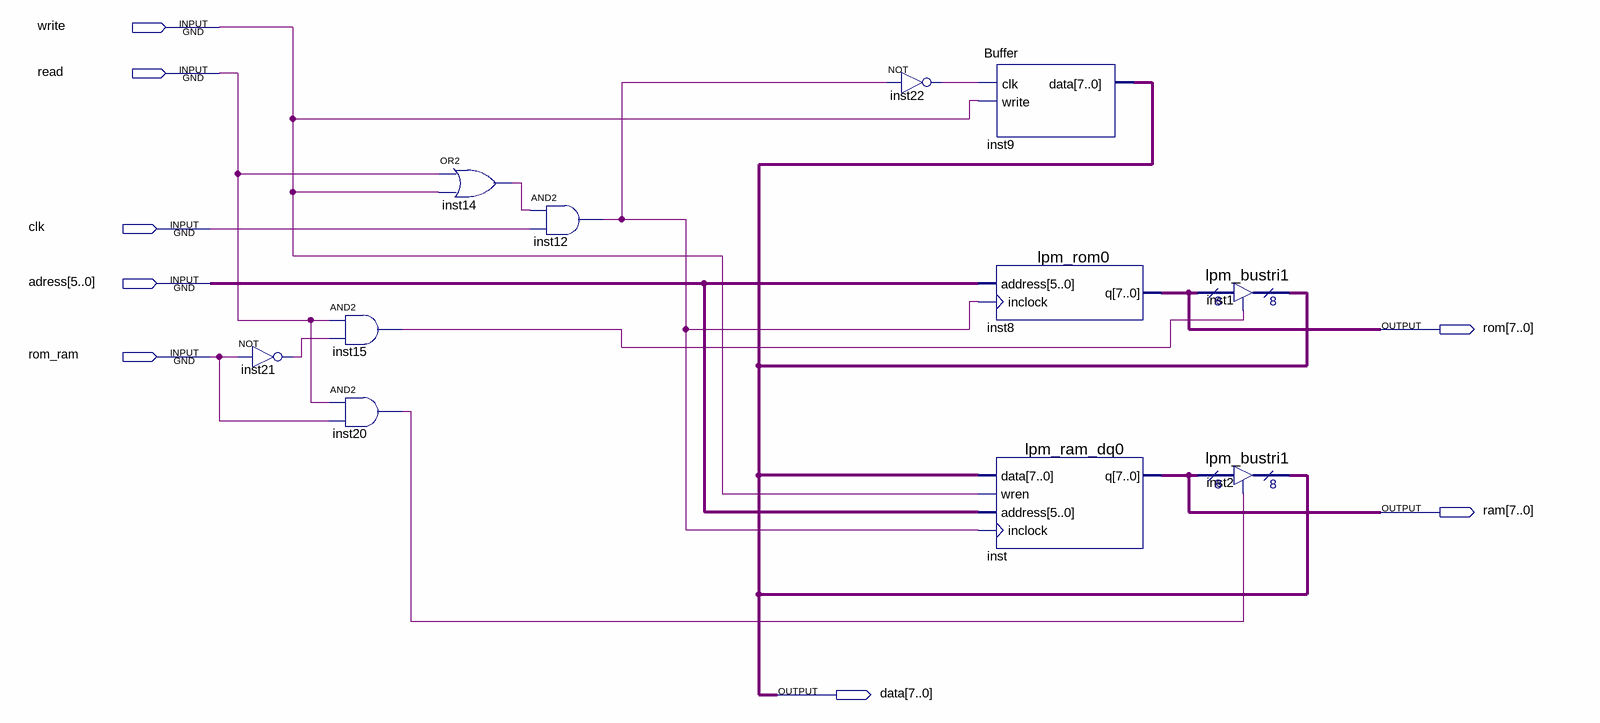
[diagram p0: schematic sheet]
// Quartus schematic lab3.bdf as structural Verilog: 11 symbols, 8 pins
module lab3 (
  input  write,
  input  read,
  input  clk,
  input  [5:0] adress,
  input  rom_ram,
  output [7:0] rom,
  output [7:0] ram,
  output [7:0] data
);

  wire inst12_out, inst14_out, inst15_out, inst20_out, inst21_out, inst22_out;

  not inst21 (inst21_out, rom_ram);
  and inst15 (inst15_out, read, inst21_out);
  and inst20 (inst20_out, read, rom_ram);
  or inst14 (inst14_out, read, write);
  and inst12 (inst12_out, inst14_out, clk);
  not inst22 (inst22_out, inst12_out);
  Buffer inst9 (.clk(inst22_out), .write(write), .data(data));
  lpm_rom0 inst8 (.address(adress), .inclock(inst12_out), .q(rom));
  lpm_ram_dq0 inst (.data(data), .wren(write), .address(adress), .inclock(inst12_out), .q(ram));
  lpm_bustri1 inst1 (.enabledt(inst15_out), .data(rom), .tridata(data));
  lpm_bustri1 inst2 (.enabledt(inst20_out), .data(ram), .tridata(data));
endmodule
